# EAGLE design Box of Beezz - Drone Synth V1 (EAGLE 9.6.2)
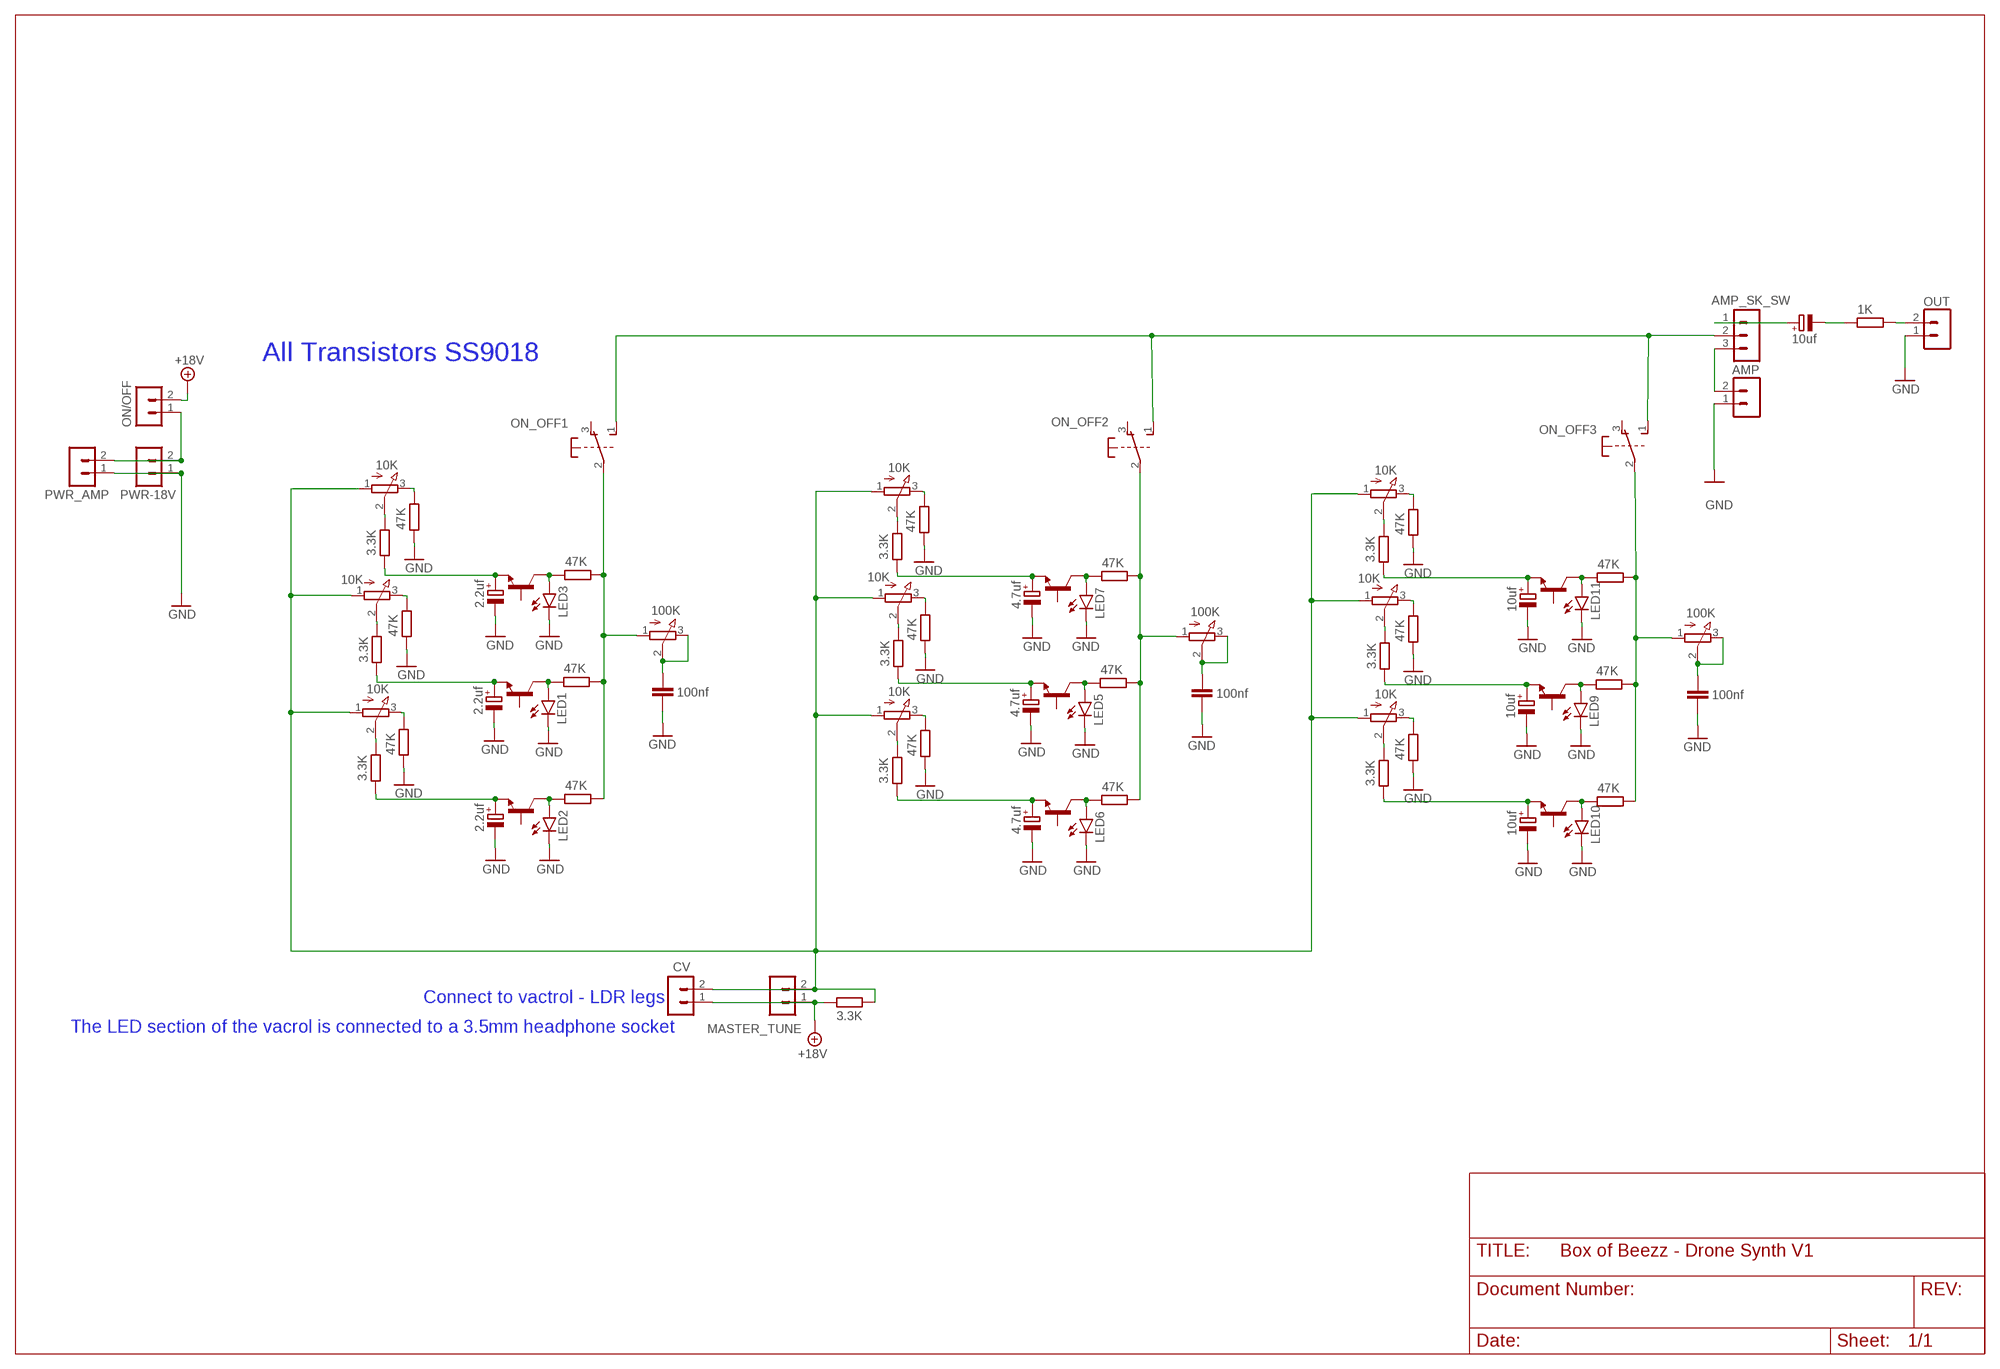
[diagram p0: schematic, sheet 1]

## Parts
AMP  B2B-PH-KL  [B2B-PH-K-S]
AMP_SK_SW  B3B-PH-K-S  [B3B-PH-K-S]
C1  2.2uf  CPOL-EUE2-5  [E2-5]
C2  2.2uf  CPOL-EUE2-5  [E2-5]
C3  2.2uf  CPOL-EUE2-5  [E2-5]
C4  10uf  CPOL-EUE2-5  [E2-5]
C5  4.7uf  CPOL-EUE2-5  [E2-5]
C6  100nf  C-EU050-024X044  [C050-024X044]
C7  4.7uf  CPOL-EUE2-5  [E2-5]
C8  4.7uf  CPOL-EUE2-5  [E2-5]
C10  100nf  C-EU050-024X044  [C050-024X044]
C11  10uf  CPOL-EUE2-5  [E2-5]
C12  10uf  CPOL-EUE2-5  [E2-5]
C13  10uf  CPOL-EUE2-5  [E2-5]
C15  100nf  C-EU050-024X044  [C050-024X044]
CV  B2B-PH-KL  [B2B-PH-K-S]
LED1  LED3MM  [LED3MM]
LED2  LED3MM  [LED3MM]
LED3  LED3MM  [LED3MM]
LED5  LED3MM  [LED3MM]
LED6  LED3MM  [LED3MM]
LED7  LED3MM  [LED3MM]
LED9  LED3MM  [LED3MM]
LED10  LED3MM  [LED3MM]
LED11  LED3MM  [LED3MM]
MASTER_TUNE  B2B-PH-KL  [B2B-PH-K-S]
ON/OFF  B2B-PH-KL  [B2B-PH-K-S]
ON_OFF1  SWITCH-6PIN  [SWITCH-6PIN]
ON_OFF2  SWITCH-6PIN  [SWITCH-6PIN]
ON_OFF3  SWITCH-6PIN  [SWITCH-6PIN]
OUT  B2B-PH-KL  [B2B-PH-K-S]
PWR-18V  B2B-PH-KL  [B2B-PH-K-S]
PWR_AMP  B2B-PH-KL  [B2B-PH-K-S]
R1  47K  R-EU_0207/10  [0207/10]
R2  10K  EVUF2A  [EVUF]
R3  100K  EVUF2A  [EVUF]
R4  3.3K  R-EU_0207/10  [0207/10]
R5  47K  R-EU_0207/10  [0207/10]
R6  10K  EVUF2A  [EVUF]
R7  3.3K  R-EU_0207/10  [0207/10]
R8  47K  R-EU_0207/10  [0207/10]
R9  10K  EVUF2A  [EVUF]
R10  3.3K  R-EU_0207/10  [0207/10]
R11  3.3K  R-EU_0207/10  [0207/10]
R12  1K  R-EU_0207/10  [0207/10]
R13  47K  R-EU_0207/10  [0207/10]
R14  47K  R-EU_0207/10  [0207/10]
R15  10K  EVUF2A  [EVUF]
R16  100K  EVUF2A  [EVUF]
R17  47K  R-EU_0207/10  [0207/10]
R18  47K  R-EU_0207/10  [0207/10]
R19  10K  EVUF2A  [EVUF]
R20  47K  R-EU_0207/10  [0207/10]
R21  47K  R-EU_0207/10  [0207/10]
R22  10K  EVUF2A  [EVUF]
R23  3.3K  R-EU_0207/10  [0207/10]
R24  3.3K  R-EU_0207/10  [0207/10]
R25  3.3K  R-EU_0207/10  [0207/10]
R26  3.3K  R-EU_0207/10  [0207/10]
R27  47K  R-EU_0207/10  [0207/10]
R28  10K  EVUF2A  [EVUF]
R29  100K  EVUF2A  [EVUF]
R30  3.3K  R-EU_0207/10  [0207/10]
R31  47K  R-EU_0207/10  [0207/10]
R32  10K  EVUF2A  [EVUF]
R33  3.3K  R-EU_0207/10  [0207/10]
R34  47K  R-EU_0207/10  [0207/10]
R35  10K  EVUF2A  [EVUF]
R36  47K  R-EU_0207/10  [0207/10]
R37  47K  R-EU_0207/10  [0207/10]
R38  47K  R-EU_0207/10  [0207/10]
R39  47K  R-EU_0207/10  [0207/10]
R40  47K  R-EU_0207/10  [0207/10]
R41  47K  R-EU_0207/10  [0207/10]
T1  2N3904  [TO92]
T2  2N3904  [TO92]
T3  2N3904  [TO92]
T5  2N3904  [TO92]
T6  2N3904  [TO92]
T7  2N3904  [TO92]
T9  2N3904  [TO92]
T10  2N3904  [TO92]
T11  2N3904  [TO92]

## Nets
+12V: CV.1 MASTER_TUNE.1 ON/OFF.2 R11.1 ; supply symbol labelled +18V
GND: AMP.1 C1.- C2.- C3.- C5.- C6.2 C7.- C8.- C10.2 C11.- C12.- C13.- C15.2 LED1.K(C) LED2.K(C) LED3.K(C) LED5.K(C) LED6.K(C) LED7.K(C) LED9.K(C) LED10.K(C) LED11.K(C) OUT.1 PWR-18V.1 PWR_AMP.1 R13.1 R17.1 R20.1 R36.1 R37.1 R38.1 R39.1 R40.1 R41.1
N$1: C1.+ R7.1 T1.3(E)
N$2: R4.2 R9.2(S)
N$3: CV.2 MASTER_TUNE.2 R2.1(A) R6.1(A) R9.1(A) R11.2 R15.1(A) R19.1(A) R22.1(A) R28.1(A) R32.1(A) R35.1(A)
N$4: LED1.A R1.1 T1.1(C)
N$5: LED2.A R5.1 T2.1(C)
N$6: C2.+ R10.1 T2.3(E)
N$7: R2.2(S) R7.2
N$8: LED3.A R8.1 T3.1(C)
N$9: C3.+ R4.1 T3.3(E)
N$10: R6.2(S) R10.2
N$11: R6.3(E) R20.2
N$12: R2.3(E) R17.2
N$13: R9.3(E) R13.2
N$14: LED5.A R14.1 T5.1(C)
N$15: C8.+ R23.1 T7.3(E)
N$16: ON/OFF.1 PWR-18V.2 PWR_AMP.2
N$17: C6.1 R3.2(S) R3.3(E)
N$18: R28.2(S) R30.2
N$19: LED6.A R18.1 T6.1(C)
N$20: C5.+ R24.1 T5.3(E)
N$21: R32.2(S) R33.2
N$22: ON_OFF1.2(1:P) R1.2 R3.1(A) R5.2 R8.2
N$23: C7.+ R25.1 T6.3(E)
N$24: ON_OFF2.2(1:P) R14.2 R16.1(A) R18.2 R21.2
N$25: ON_OFF3.2(1:P) R27.2 R29.1(A) R31.2 R34.2
N$26: C4.- R12.1
N$27: AMP_SK_SW.1 C4.+
N$28: C10.1 R16.2(S) R16.3(E)
N$29: OUT.2 R12.2
N$30: LED9.A R27.1 T9.1(C)
N$31: C13.+ R26.1 T11.3(E)
N$32: AMP.2 AMP_SK_SW.3
N$33: LED10.A R31.1 T10.1(C)
N$34: C11.+ R30.1 T9.3(E)
N$35: R26.2 R35.2(S)
N$36: LED11.A R34.1 T11.1(C)
N$37: C12.+ R33.1 T10.3(E)
N$38: R22.2(S) R23.2
N$39: R15.2(S) R24.2
N$40: R19.2(S) R25.2
N$41: LED7.A R21.1 T7.1(C)
N$42: C15.1 R29.2(S) R29.3(E)
N$43: AMP_SK_SW.2 ON_OFF1.1(1:S) ON_OFF2.1(1:S) ON_OFF3.1(1:S)
N$44: R32.3(E) R41.2
N$45: R28.3(E) R40.2
N$46: R35.3(E) R39.2
N$47: R22.3(E) R36.2
N$48: R15.3(E) R37.2
N$49: R19.3(E) R38.2
Unconnected: ON_OFF1.3(1:O) ON_OFF1.4(2:S) ON_OFF1.5(2:P) ON_OFF1.6(2:O) ON_OFF2.3(1:O) ON_OFF2.4(2:S) ON_OFF2.5(2:P) ON_OFF2.6(2:O) ON_OFF3.3(1:O) ON_OFF3.4(2:S) ON_OFF3.5(2:P) ON_OFF3.6(2:O) T1.2(B) T2.2(B) T3.2(B) T5.2(B) T6.2(B) T7.2(B) T9.2(B) T10.2(B) T11.2(B)

## Notes on the sheet
- All Transistors SS9018
- Connect to vactrol - LDR legs
- The LED section of the vacrol is connected to a 3.5mm headphone socket

## Library data of the parts
AMP CV MASTER_TUNE ON/OFF OUT PWR-18V PWR_AMP = con-JST PH:B2B-PH: JST PH series header 2.00mm pitch disconnectable crimp style connectors, vertical (side entry type), 2 pins
AMP_SK_SW = con-JST PH:B3B-PH: JST PH series header 2.00mm pitch disconnectable crimp style connectors, vertical (side entry type), 3 pins
C1-C5 C7 C8 C11-C13 = rcl:CPOL-EU: POLARIZED CAPACITOR, European symbol; SPICEPREFIX: C
C6 C10 C15 = rcl:C-EU: CAPACITOR, European symbol; SPICEPREFIX: C
LED1-LED3 LED5-LED7 LED9-LED11 = led:LED: LED OSRAM: - CHIPLED LG R971, LG N971, LY N971, LG Q971, LY Q971, LO R971, LY R971 LH N974, LH R974 LS Q976, LO Q976, LY Q976 LO Q996 - Hyper CHIPLED LW Q18S LB Q993, LB Q99A, LB R99A - SideLED LS A670, LO A670, LY A670, LG A670, LP A670 LB A673, LV A673, LT A673, LW A673 LH A674 LY A675 LS A676, LA A676, LO A676, LY A676, LW A676 LS A679, LY A679, LG A679 - Hyper Micro SIDELED® LS Y876, LA Y876, LO Y876, LY Y876 LT Y87S - SmartLED LW L88C, LW L88S LB L89C, LB L89S, LG L890 LS L89K, LO L89K, LY L89K LS L896, LA L896, LO L896, LY L896 - TOPLED LS T670, LO T670, LY T670, LG T670, LP T670 LSG T670, LSP T670, LSY T670, LOP T670, LYG T670 LG T671, LOG T671, LSG T671 LB T673, LV T673, LT T673, LW T673 LH T674 LS T676, LA T676, LO T676, LY T676, LB T676, LH T676, LSB T676, LW T676 LB T67C, LV T67C, LT T67C, LS T67K, LO T67K, LY T67K, LW E67C LS E67B, LA E67B, LO E67B, LY E67B, LB E67C, LV E67C, LT E67C LW T67C LS T679, LY T679, LG T679 LS T770, LO T770, LY T770, LG T770, LP T770 LB T773, LV T773, LT T773, LW T773 LH T774 LS E675, LA E675, LY E675, LS T675 LS T776, LA T776, LO T776, LY T776, LB T776 LHGB T686 LT T68C, LB T68C - Hyper Mini TOPLED® LB M676 - Mini TOPLED Santana® LG M470 LS M47K, LO M47K, LY M47K Source: http://www.osram.convergy.de LUXEON: - LUMILED® LXK2-PW12-R00, LXK2-PW12-S00, LXK2-PW14-U00, LXK2-PW14-V00 LXK2-PM12-R00, LXK2-PM12-S00, LXK2-PM14-U00 LXK2-PE12-Q00, LXK2-PE12-R00, LXK2-PE12-S00, LXK2-PE14-T00, LXK2-PE14-U00 LXK2-PB12-K00, LXK2-PB12-L00, LXK2-PB12-M00, LXK2-PB14-N00, LXK2-PB14-P00, LXK2-PB14-Q00 LXK2-PR12-L00, LXK2-PR12-M00, LXK2-PR14-Q00, LXK2-PR14-R00 LXK2-PD12-Q00, LXK2-PD12-R00, LXK2-PD12-S00 LXK2-PH12-R00, LXK2-PH12-S00 LXK2-PL12-P00, LXK2-PL12-Q00, LXK2-PL12-R00 Source: www.luxeon.com KINGBRIGHT: KA-3528ASYC Source: www.kingbright.com
ON_OFF1-ON_OFF3 = My Library:SWITCH-6PIN: ITT SWITCH
R1 R4 R5 R7 R8 R10-R14 R17 R18 R20 R21 R23-R27 R30 R31 R33 R34 R36-R41 = rcl:R-EU_: RESISTOR, European symbol; SPICEPREFIX: R
R2 R3 R6 R9 R15 R16 R19 R22 R28 R29 R32 R35 = pot:EVU: 9 mm Square Rotary Potentiometers Source: Panasonic
T1-T3 T5-T7 T9-T11 = transistor:2N3904: NPN TRANSISTOR

## Board
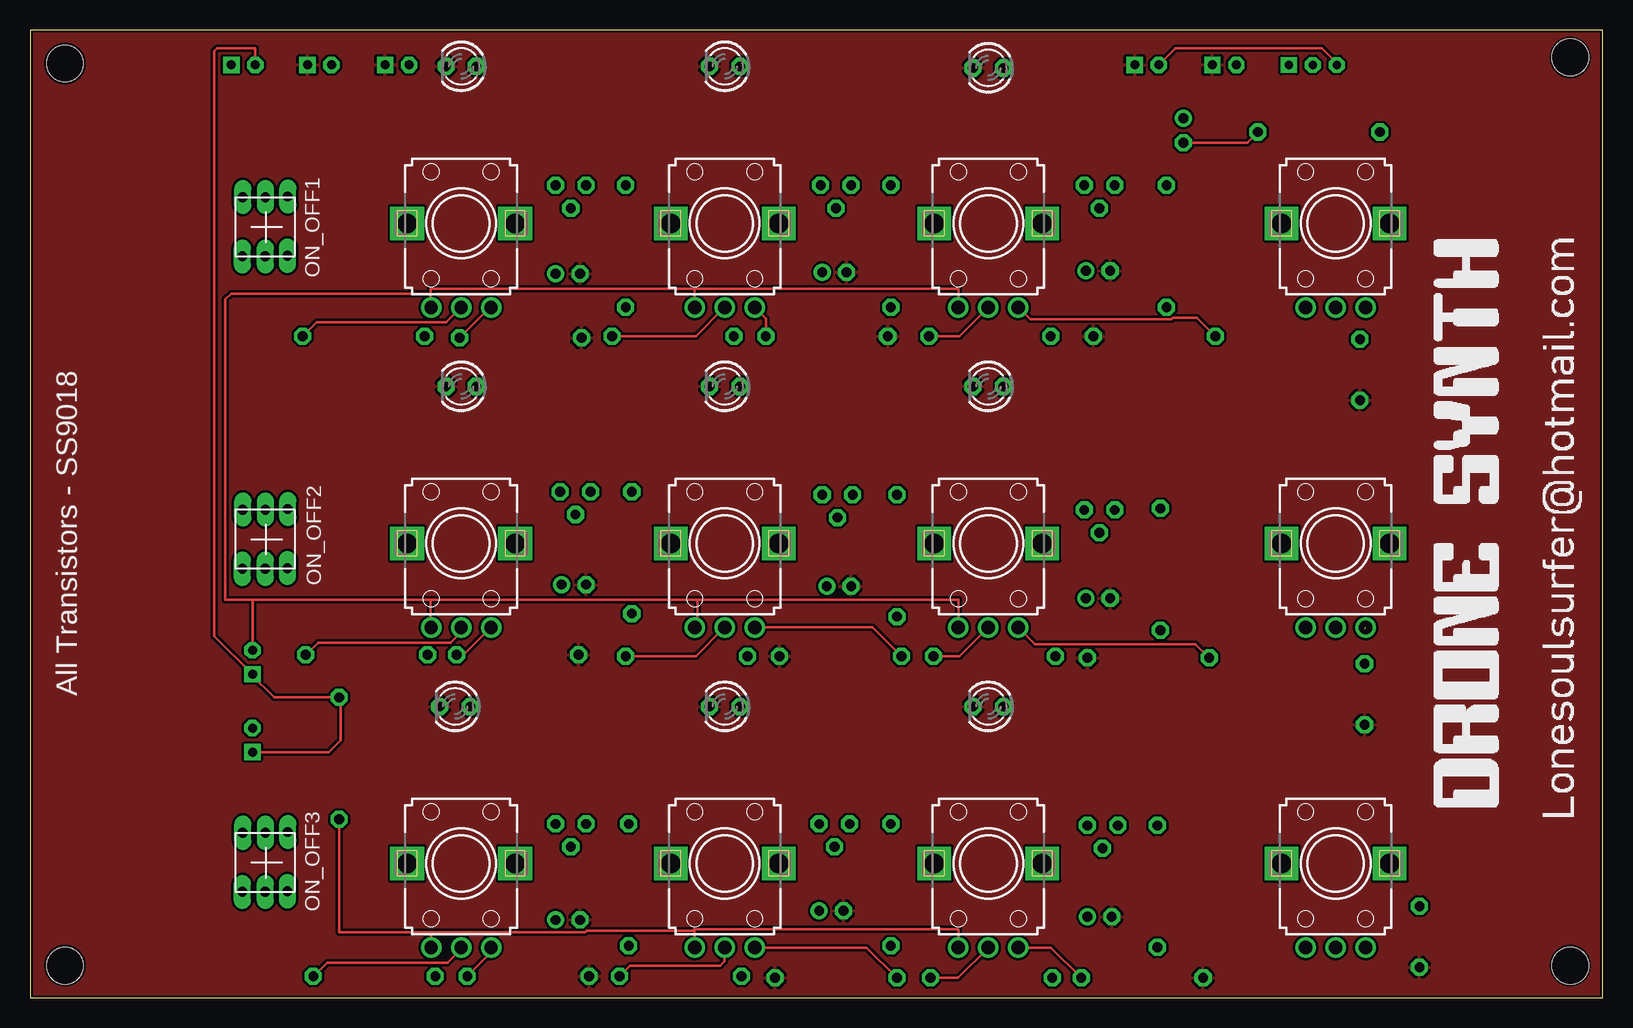
[diagram p1: board, top side]
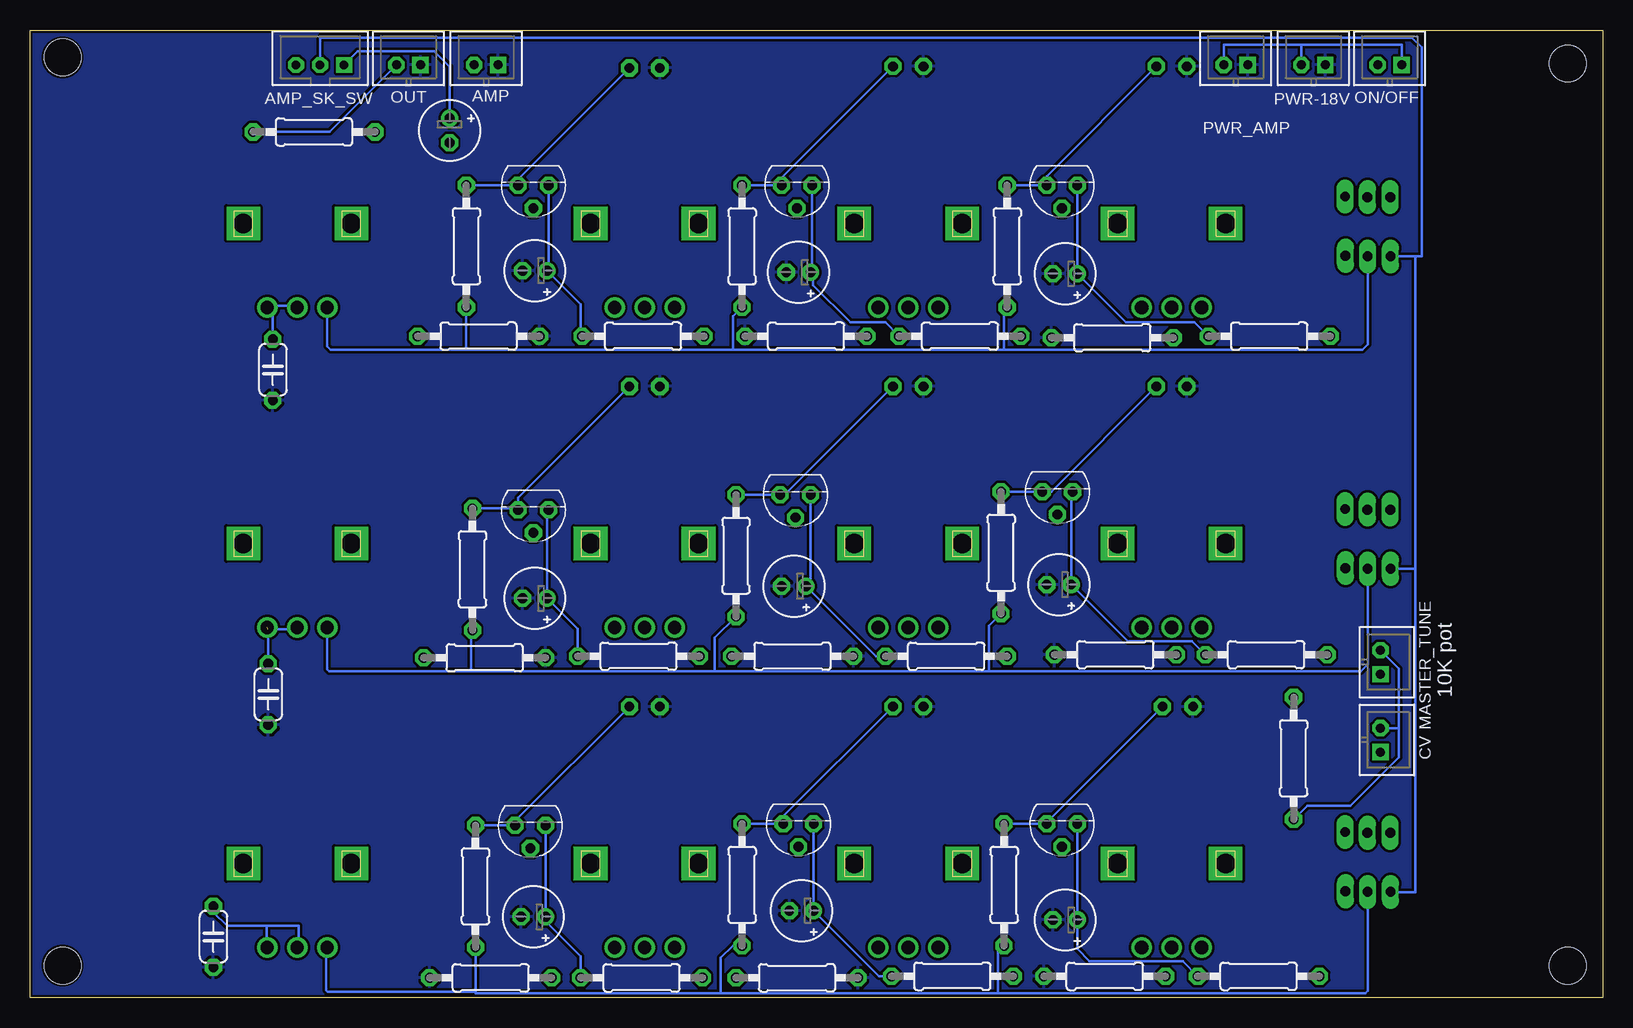
[diagram p2: board, bottom side, seen from below]

Size 131.12 x 80.64 mm. Coordinates in mm from the lower left corner, seen from the top.
Outline: 0,0 131.12,0 131.12,80.64 0,80.64 0,0
Copper layers (1*16): Top 0.035mm / dielectric 1.5mm / Bottom 0.035mm
Design rules "SparkFun": minimum track width 8mil, minimum drill 20mil, track to track 8mil, track to pad 8mil, pad to pad 8mil, via to via 8mil, smd to smd 8mil, copper to edge 8mil, drill to drill 8mil, minimum pad ring 12mil, minimum via ring 10mil, stop-mask expansion 4mil, vias tented up to drill 20mil, thermal gap 10mil
Holes 3.05 mm at 2.92,77.85 2.92,2.67 128.4,2.67 128.4,78.36

### Footprints (pad centres in the part's own frame; a part is rotated, then mirrored left to right if it is on the bottom)
B2B-PH-K-S = drill 0.75 pad 1.3 square: 1 1,0 | drill 0.75 pad 1.3 octagon: 2 -1,0
B3B-PH-K-S = drill 0.7 pad 1.3 square: 1 2,0 | drill 0.7 pad 1.3 octagon: 2 0,0; 3 -2,0
E2-5 = drill 0.813 pad 1.27: + -1.016,0 | drill 0.813 pad 1.27 octagon: - 1.016,0
C050-024X044 = drill 0.813 octagon: 1 -2.54,0; 2 2.54,0
LED3MM = drill 0.813 octagon: A -1.27,0; K 1.27,0
SWITCH-6PIN = drill 0.813 long: 1 -2.997,2.489; 2 -2.997,0.584; 3 -2.946,-1.27; 4 1.93,2.464; 5 1.93,0.559; 6 1.981,-1.295
0207/10 = drill 0.813 octagon: 1 -5.08,0; 2 5.08,0
EVUF = drill 1.1 pad 1.676: 1 -2.5,-7; 2 0,-7; 3 2.5,-7 | drill 1.6 pad 2.8 square: M1 4.5,0; M2 -4.5,0
TO92 = drill 0.813 octagon: 1 1.27,0; 2 0,1.905; 3 -1.27,0

### Placement (x,y rotation side)
AMP  93.09,77.72 0 bottom
AMP_SK_SW  106.93,77.72 0 bottom
C1  44.83,60.32 180 bottom
C2  67.06,60.45 180 bottom
C3  89.03,60.58 180 bottom
C4  96.14,72.26 270 bottom
C5  45.34,34.42 180 bottom
C6  110.87,52.32 270 bottom
C7  67.44,34.29 180 bottom
C8  89.03,33.27 180 bottom
C10  111.25,25.27 270 bottom
C11  44.83,6.48 180 bottom
C12  66.8,7.24 180 bottom
C13  89.15,6.73 180 bottom
C15  115.82,5.08 270 bottom
CV  18.54,21.46 270 bottom
LED1  35.94,77.6 180 top
LED2  57.91,77.6 180 top
LED3  79.88,77.47 180 top
LED5  35.94,50.93 180 top
LED6  57.91,50.93 180 top
LED7  79.88,50.93 180 top
LED9  35.43,24.26 180 top
LED10  57.91,24.26 180 top
LED11  79.88,24.26 180 top
MASTER_TUNE  18.54,27.94 270 bottom
ON/OFF  17.78,77.72 0 bottom
ON_OFF1  20.19,64.77 90 top
ON_OFF2  20.19,38.73 90 top
ON_OFF3  20.19,11.81 90 top
OUT  99.57,77.72 0 bottom
PWR-18V  24.13,77.72 0 bottom
PWR_AMP  30.61,77.72 0 bottom
R1  49.66,62.61 270 bottom
R2  35.94,64.52 0 top
R3  108.84,64.52 0 top
R4  80.01,55.12 0 bottom
R5  71.75,62.61 270 bottom
R6  57.91,64.52 0 top
R7  27.81,55.12 0 bottom
R8  94.74,62.61 270 bottom
R9  79.88,64.52 0 top
R10  53.59,55.12 0 bottom
R11  25.78,19.94 270 bottom
R12  107.44,72.14 180 bottom
R13  93.73,55.12 180 bottom
R14  50.17,37.08 270 bottom
R15  35.94,37.85 0 top
R16  108.84,37.85 0 top
R17  40.89,54.99 0 bottom
R18  72.26,36.83 270 bottom
R19  57.91,37.85 0 top
R20  66.42,55.12 0 bottom
R21  94.23,35.69 270 bottom
R22  79.88,37.85 0 top
R23  80.39,28.45 0 bottom
R24  28.07,28.58 0 bottom
R25  54.74,28.45 0 bottom
R26  80.14,1.65 0 bottom
R27  49.91,9.4 270 bottom
R28  35.94,11.18 0 top
R29  108.84,11.18 0 top
R30  28.7,1.78 0 bottom
R31  71.75,9.4 270 bottom
R32  57.91,11.18 0 top
R33  54.23,1.78 0 bottom
R34  93.98,9.27 270 bottom
R35  79.88,11.18 0 top
R36  93.22,28.32 180 bottom
R37  40.64,28.58 0 bottom
R38  67.56,28.45 180 bottom
R39  92.71,1.65 0 bottom
R40  41.53,1.78 0 bottom
R41  67.18,1.65 180 bottom
T1  45.09,67.69 180 bottom
T2  67.18,67.69 180 bottom
T3  89.15,67.69 180 bottom
T5  45.47,42.16 180 bottom
T6  67.31,41.91 180 bottom
T7  89.15,40.64 180 bottom
T9  45.09,14.48 180 bottom
T10  67.06,14.48 180 bottom
T11  89.41,14.35 180 bottom

### Tracks (layer width: path | path; a pad name or v marks a point on that pad's centre or on a via)
+12V
  Top 0.203: 18.4,26.94 18.42,26.94 | 18.42,26.94 MASTER_TUNE.1 15.37,30.12 15.37,78.87 15.62,79.12 18.78,79.12 ON/OFF.2 18.78,77.71 | 18.42,26.94 20.34,25.02 R11.1 25.91,24.89 25.91,21.46 24.91,20.46 CV.1
GND
  pour Top: 0,80.65 131.06,80.65 131.06,0 0,0
  pour Bottom: 0,80.65 131.06,80.65 131.06,0 0,0
N$1
  Bottom 0.203: T1.3 C1.+ 39.75,56.26 34.04,56.26 R7.1
N$2
  Top 0.203: R9.2 77.48,55.12 R4.2
N$3
  Top 0.203: R11.2 25.78,5.45 25.8,5.46 33.44,5.46 | 55.25,5.59 46.39,5.59 46.27,5.46 33.44,5.46 | 55.25,5.59 55.37,5.59 55.41,5.55 R32.1 | 55.25,5.59 55.37,5.71 77.34,5.71 77.38,5.67 R35.1 | 18.67,33.15 16.28,33.15 16.28,58.19 16.76,58.67 33.4,58.67 | 18.67,33.15 33.4,33.15 | 33.4,33.15 55.63,33.15 | 55.63,33.15 55.63,31.06 R19.1 | 55.63,33.15 77.38,33.15 R22.1 | R2.1 33.4,57.56 33.4,58.67 | 33.4,58.67 33.4,59.05 55.37,59.05 | 55.37,59.05 55.41,59.02 R6.1 | 55.37,59.05 77.34,59.05 77.38,59.02 R9.1 | R15.1 33.4,30.89 33.4,33.15 | R28.1 33.44,5.46 | MASTER_TUNE.2 18.54,33.02 18.67,33.15
  Bottom 0.203: MASTER_TUNE.2 17.02,27.42 17.02,22.48 | 17.02,22.48 17.02,20.05 21.07,16 24.64,16 R11.2 | CV.2 17.03,22.46 17.02,22.48
N$4
  Bottom 0.203: LED1.A 46.36,68.45 T1.1 R1.1
N$5
  Bottom 0.203: LED2.A 68.45,68.33 T2.1 R5.1
N$6
  Bottom 0.203: T2.3 65.91,60.58 C2.+ 65.85,60.26 65.85,59.37 62.74,56.26 59.82,56.26 R10.1
N$7
  Top 0.203: R7.2 23.88,56.26 34.69,56.26 R2.2
N$8
  Bottom 0.203: LED3.A 90.42,68.2 T3.1 R8.1
N$9
  Bottom 0.203: T3.3 87.88,60.71 C3.+ 85.22,57.78 85.22,55.24 R4.1
N$10
  Top 0.203: R10.2 55.51,55.12 R6.2
N$11
  Top 0.203: R6.3 61.34,56.59 R20.2
N$12  (via drill 0.51)
  Top 0.203: v38.21,57.52 38.23,57.52 | 38.23,57.52 R2.3 | R17.2 38.23,57.4 38.23,57.52
N$13
  Top 0.203: R9.3 83.38,56.52 95.16,56.52 95.29,56.64 97.28,56.64 R13.2
N$14
  Bottom 0.203: LED5.A 45.97,42.16 T5.1 R14.1
N$15
  Bottom 0.203: T7.3 88.01,40.51 C8.+ 85.47,30.73 R23.1
N$16
  Bottom 0.203: PWR-18V.2 25.13,79.39 | ON/OFF.1 16.78,79.39 25.13,79.39 | 25.13,79.39 31.61,79.39 PWR_AMP.2
N$17
  Bottom 0.203: C6.1 110.87,57.66 | 110.87,57.66 110.12,57.66 108.7,57.66 R3.2 | 110.87,57.66 111.34,57.66 R3.3
N$18
  Top 0.203: R30.2 24.77,2.92 34.8,2.92 35.94,4.06 R28.2
N$19
  Bottom 0.203: LED6.A 68.2,41.91 T6.1 R18.1
N$20
  Bottom 0.203: T5.3 44.32,42.04 C5.+ 39.59,29.69 34.26,29.69 R24.1
N$21
  Top 0.203: R33.2 50.04,2.67 57.53,2.67 57.91,3.05 R32.2
N$22
  Bottom 0.203: ON_OFF1.2 19.61,54.43 20.07,53.98 49.91,53.98 | R1.2 49.91,57.28 49.91,53.98 | 49.91,53.98 72.52,53.98 | R5.2 72.52,56.77 72.52,53.98 | 72.52,53.98 94.74,53.98 | 94.74,53.98 R8.2 | 94.74,53.98 106.05,53.98 106.34,54.27 R3.1
N$23
  Bottom 0.203: T6.3 66.04,34.67 C7.+ 60.58,28.45 R25.1
N$24
  Bottom 0.203: ON_OFF2.2 19.61,27.76 20.19,27.18 51.18,27.18 | 74.04,27.18 71.25,27.18 70.87,27.18 51.18,27.18 | 74.04,27.18 94.36,27.18 | 94.36,27.18 106.17,27.18 106.34,27.35 R16.1 | R21.2 94.36,30.48 94.36,27.18 | R14.2 51.18,30.99 51.18,27.18 | 74.04,27.18 74.04,29.97 R18.2
N$25
  Bottom 0.203: ON_OFF3.2 19.61,0.58 19.81,0.38 50.42,0.38 | R27.2 50.42,3.81 50.42,0.38 | 73.53,0.38 70.74,0.38 70.61,0.38 50.42,0.38 | 73.53,0.38 93.98,0.38 93.98,0.51 | 93.98,0.51 106.3,0.51 106.43,0.64 106.43,4.09 R29.1 | R34.2 93.98,0.51 | R31.2 72.52,4.32 73.53,3.3 73.53,0.38
N$26
  Top 0.203: R12.1 101.47,71.25 C4.-
N$27
  Bottom 0.203: AMP_SK_SW.1 103.79,78.87 97.44,78.87 96.14,77.57 C4.+
N$28  (1 unrouted)
  Bottom 0.203: C10.1 111.25,30.76 R16.3 | 111.25,30.72 108.97,30.72 R16.2
N$29
  Bottom 0.203: OUT.2 106.16,72.14 R12.2
N$30
  Bottom 0.203: LED9.A 46.36,14.61 T9.1 R27.1
N$31
  Bottom 0.203: T11.3 C13.+ 88.14,6.35 85.22,3.43 R26.1
N$32
  Top 0.203: AMP.2 95.49,79.12 107.7,79.12 108.93,77.88 AMP_SK_SW.3
N$33
  Bottom 0.203: LED10.A 68.33,15.11 T10.1 R31.1
N$34
  Bottom 0.203: T9.3 C11.+ 43.81,4.06 42.8,3.05 38.95,3.05 38.92,3.02 35.02,3.02 R30.1
N$35
  Top 0.203: R26.2 77.36,1.65 R35.2
N$36
  Bottom 0.203: LED11.A 90.68,14.73 T11.1 R34.1
N$37
  Bottom 0.203: T10.3 C12.+ 60.33,1.78 R33.1
N$38
  Top 0.203: R23.2 77.48,28.45 R22.2
N$39
  Top 0.203: R24.2 24,29.59 35.05,29.59 35.94,30.48 R15.2
N$40
  Top 0.203: R25.2 55.51,28.45 R19.2
N$41
  Bottom 0.203: LED7.A 90.42,41.66 T7.1 90.55,40.77 R21.1
N$42
  Bottom 0.203: C15.1 115.82,7.11 114.68,5.97 111.38,5.97 | 111.38,5.97 111.38,4.22 R29.3 | 111.38,5.97 108.71,5.97 108.71,4.3 R29.2
N$43
  Bottom 0.203: ON_OFF1.1 15.62,61.77 | 15.62,61.77 15.11,61.77 15.11,79.19 15.94,80.01 106.93,80.01 AMP_SK_SW.2 | ON_OFF2.1 15.62,35.74 | 15.62,61.77 15.62,35.74 | ON_OFF3.1 17.65,8.76 15.62,8.76 15.62,35.74
N$44
  Top 0.203: R32.3 69.74,4.18 R41.2
N$45
  Top 0.203: R40.2 38.44,3.77 R28.3
N$46
  Top 0.203: R35.3 85.11,4.18 R39.2
N$47
  Top 0.203: R22.3 83.77,29.46 97.16,29.46 R36.2
N$48
  Top 0.203: R15.3 36.25,28.65 35.64,28.65 R37.2
N$49
  Top 0.203: R19.3 70.25,30.85 R38.2

### Text on the board
tPlace: All Transistors - SS9018
bPlace: 10K pot